# Altium schematic sheet Top-Sheet.SchDoc
size A4; SheetNumber: 1; SheetTotal: 5
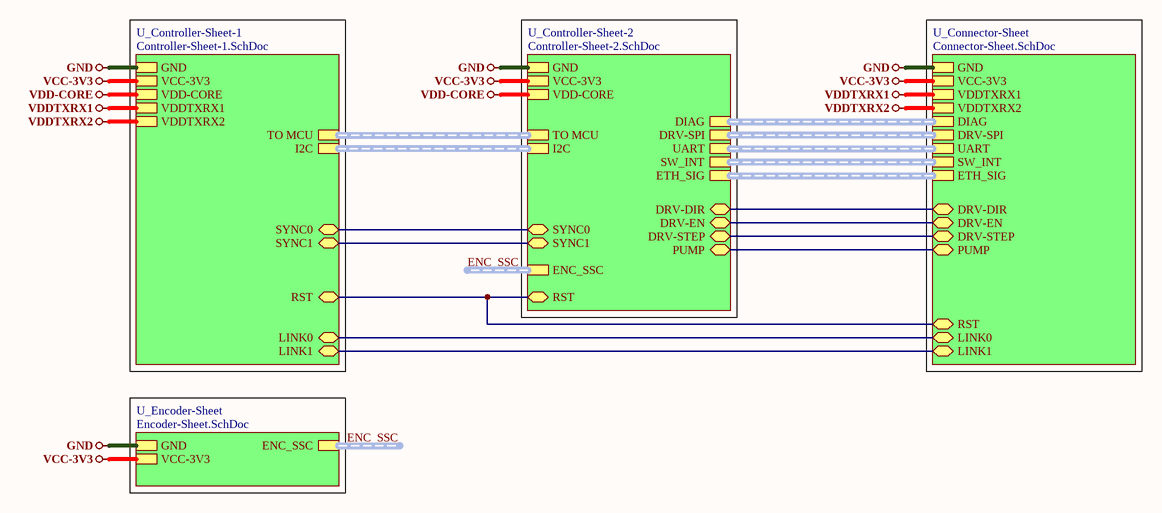
[diagram p0: Top-Sheet.SchDoc]

## Sub-sheets
U_Connector-Sheet = Connector-Sheet.SchDoc: VDDTXRX2, GND, VDDTXRX1, VCC-3V3, DIAG (harness DIAG), DRV-SPI (harness DRV-SPI), UART (harness UART), SW_INT (harness SW_INT), DRV-STEP (bidir), DRV-DIR (bidir), DRV-EN (bidir), PUMP (bidir), ETH_SIG (harness ETH_SIG), LINK0 (bidir), LINK1 (bidir), RST (bidir)
U_Controller-Sheet-1 = Controller-Sheet-1.SchDoc: GND, VCC-3V3, TO MCU (harness To MCU), I2C (harness I2C), VDDTXRX2, VDDTXRX1, RST (bidir), SYNC0 (bidir), SYNC1 (bidir), LINK0 (bidir), LINK1 (bidir), VDD-CORE
U_Controller-Sheet-2 = Controller-Sheet-2.SchDoc: ETH_SIG (harness ETH_SIG), ENC_SSC (harness ENC_SSC), SW_INT (harness SW_INT), TO MCU (harness To MCU), UART (harness UART), GND, VCC-3V3, I2C (harness I2C), SYNC0 (bidir), SYNC1 (bidir), RST (bidir), VDD-CORE, DIAG (harness DIAG), DRV-STEP (bidir), DRV-DIR (bidir), DRV-EN (bidir), DRV-SPI (harness DRV-SPI), PUMP (bidir)
U_Encoder-Sheet = Encoder-Sheet.SchDoc: GND, VCC-3V3, ENC_SSC (harness ENC_SSC)

## Nets
GND: sheet U_Controller-Sheet-1/GND, sheet U_Controller-Sheet-2/GND, sheet U_Encoder-Sheet/GND, sheet U_Connector-Sheet/GND
VCC-3V3: sheet U_Controller-Sheet-1/VCC-3V3, sheet U_Controller-Sheet-2/VCC-3V3, sheet U_Encoder-Sheet/VCC-3V3, sheet U_Connector-Sheet/VCC-3V3
VDD-CORE: sheet U_Controller-Sheet-1/VDD-CORE, sheet U_Controller-Sheet-2/VDD-CORE
VDDTXRX1: sheet U_Controller-Sheet-1/VDDTXRX1, sheet U_Connector-Sheet/VDDTXRX1
VDDTXRX2: sheet U_Controller-Sheet-1/VDDTXRX2, sheet U_Connector-Sheet/VDDTXRX2
(unnamed): sheet U_Controller-Sheet-1/RST, sheet U_Controller-Sheet-2/RST, sheet U_Connector-Sheet/RST
(unnamed): sheet U_Controller-Sheet-1/SYNC0, sheet U_Controller-Sheet-2/SYNC0
(unnamed): sheet U_Controller-Sheet-1/SYNC1, sheet U_Controller-Sheet-2/SYNC1
(unnamed): sheet U_Controller-Sheet-1/LINK0, sheet U_Connector-Sheet/LINK0
(unnamed): sheet U_Controller-Sheet-1/LINK1, sheet U_Connector-Sheet/LINK1
(unnamed): sheet U_Controller-Sheet-2/DRV-STEP, sheet U_Connector-Sheet/DRV-STEP
(unnamed): sheet U_Controller-Sheet-2/DRV-DIR, sheet U_Connector-Sheet/DRV-DIR
(unnamed): sheet U_Controller-Sheet-2/DRV-EN, sheet U_Connector-Sheet/DRV-EN
(unnamed): sheet U_Controller-Sheet-2/PUMP, sheet U_Connector-Sheet/PUMP

## Buses and harness runs
harness ENC_SSC = sheet U_Controller-Sheet-2/ENC_SSC
harness ENC_SSC = sheet U_Encoder-Sheet/ENC_SSC
harness sheet U_Connector-Sheet/DIAG = sheet U_Controller-Sheet-2/DIAG
harness sheet U_Connector-Sheet/DRV-SPI = sheet U_Controller-Sheet-2/DRV-SPI
harness sheet U_Connector-Sheet/ETH_SIG = sheet U_Controller-Sheet-2/ETH_SIG
harness sheet U_Connector-Sheet/SW_INT = sheet U_Controller-Sheet-2/SW_INT
harness sheet U_Connector-Sheet/UART = sheet U_Controller-Sheet-2/UART
harness sheet U_Controller-Sheet-1/I2C = sheet U_Controller-Sheet-2/I2C
harness sheet U_Controller-Sheet-1/TO MCU = sheet U_Controller-Sheet-2/TO MCU

## Notes on the sheet
- File:
- Title:
- Date:
- Page
- Num:
- Total:
- Drawn By: Huzaifa Ali